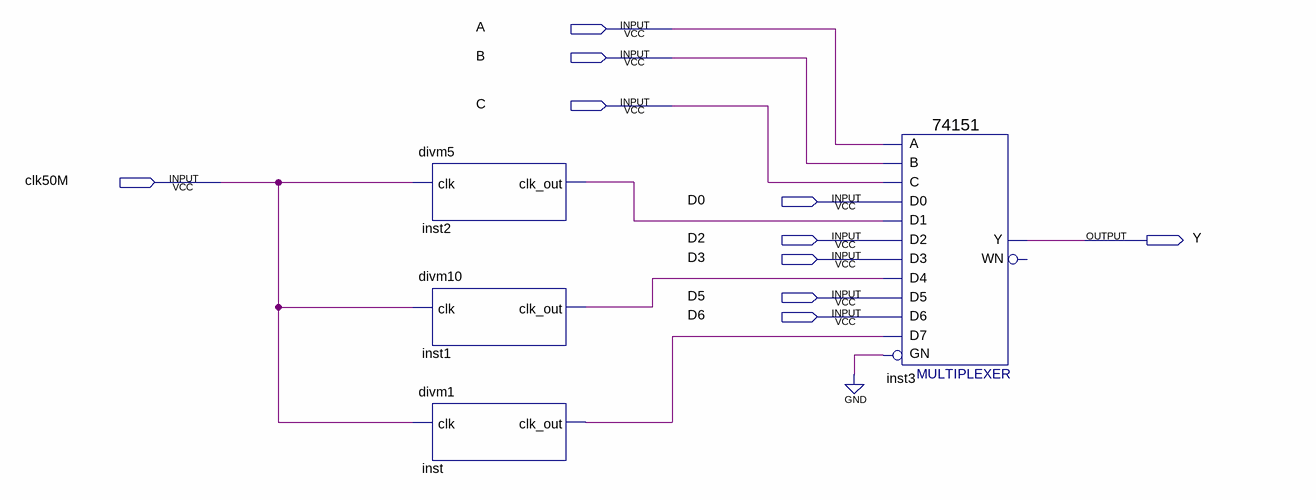
[diagram p0: schematic sheet]
// Quartus schematic frequency2.bdf as structural Verilog: 4 symbols, 10 pins
module frequency2 (
  input  A,
  input  B,
  input  C,
  input  clk50M,
  input  D0,
  input  D2,
  input  D3,
  input  D5,
  input  D6,
  output Y
);

  wire inst1_clk_out, inst2_clk_out, inst_clk_out;

  divm5 inst2 (.clk(clk50M), .clk_out(inst2_clk_out));
  divm10 inst1 (.clk(clk50M), .clk_out(inst1_clk_out));
  divm1 inst (.clk(clk50M), .clk_out(inst_clk_out));
  \74151  inst3 (
    .GN(1'b0), .C(C), .B(B), .A(A), .D5(D5), .D0(D0), .D1(inst2_clk_out), .D4(inst1_clk_out), .D3(D3),
    .D2(D2), .D6(D6), .D7(inst_clk_out), .Y(Y));  // open: WN
endmodule
